# EasyEDA Pro project ProPrj_ROV_MINI_CTRL_2026-11-13.epro, board ROV_MINI_CTRL_V2.0.0_1
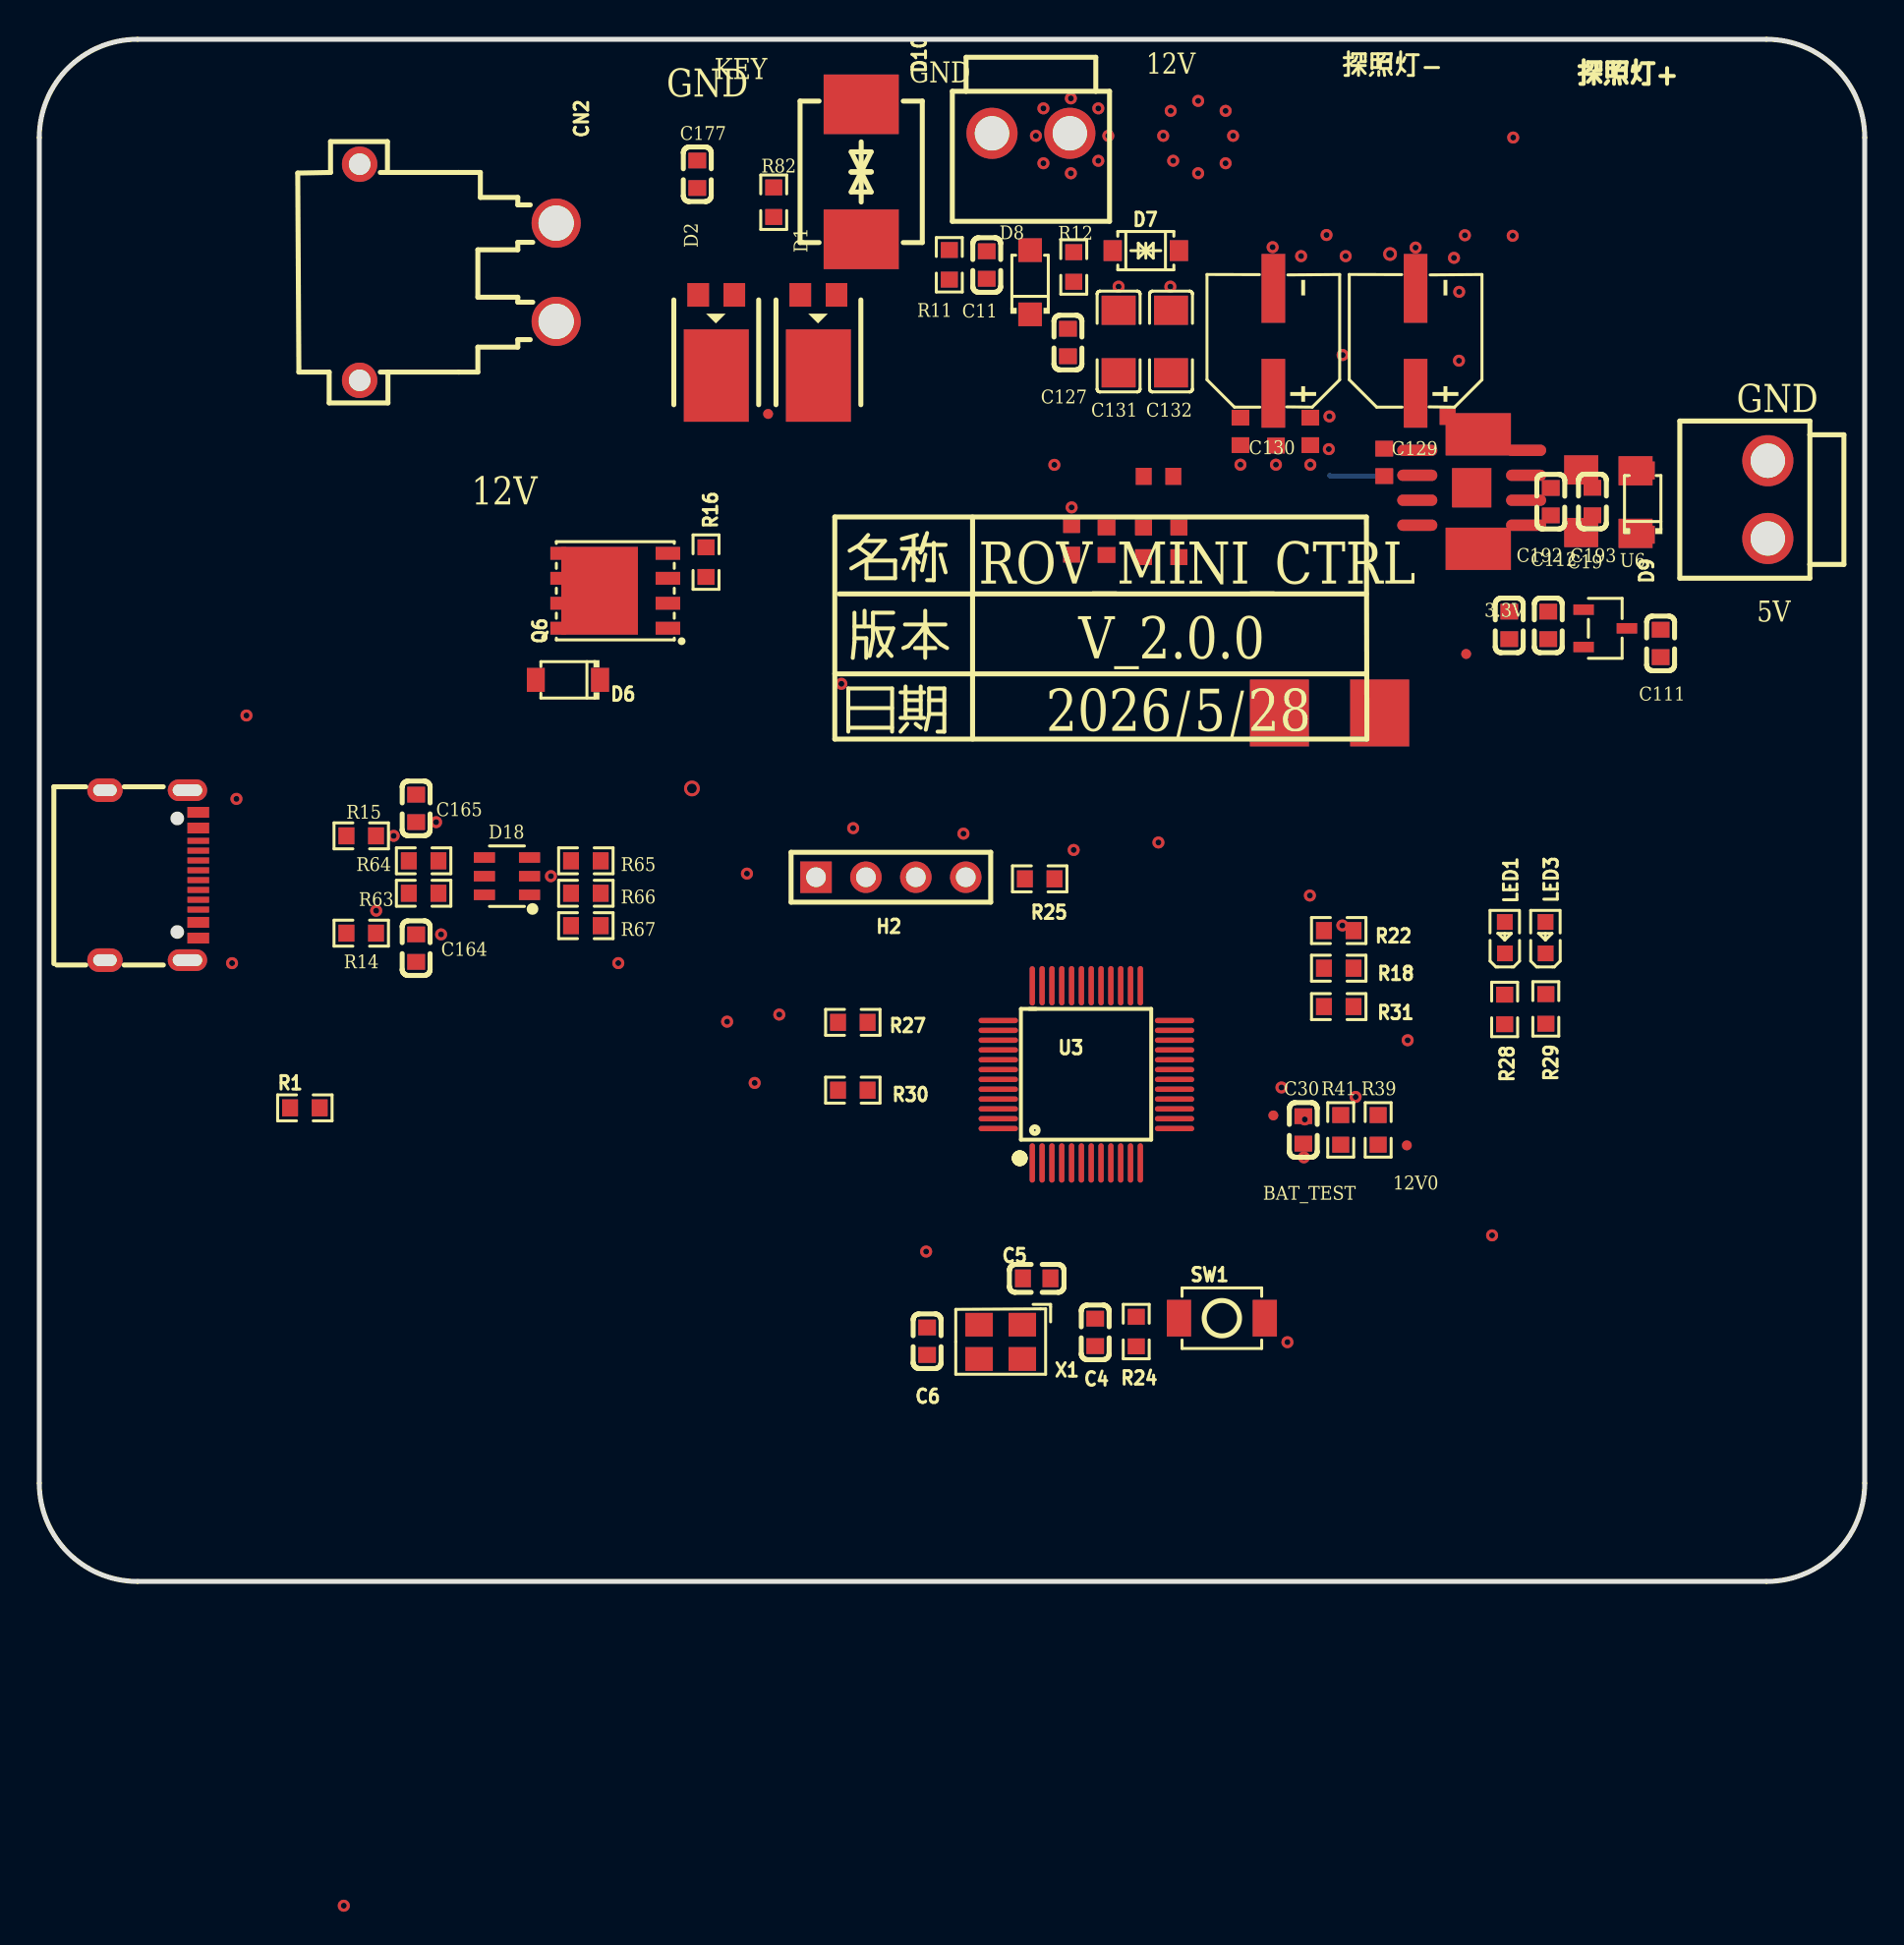
[diagram p16: board, top side]
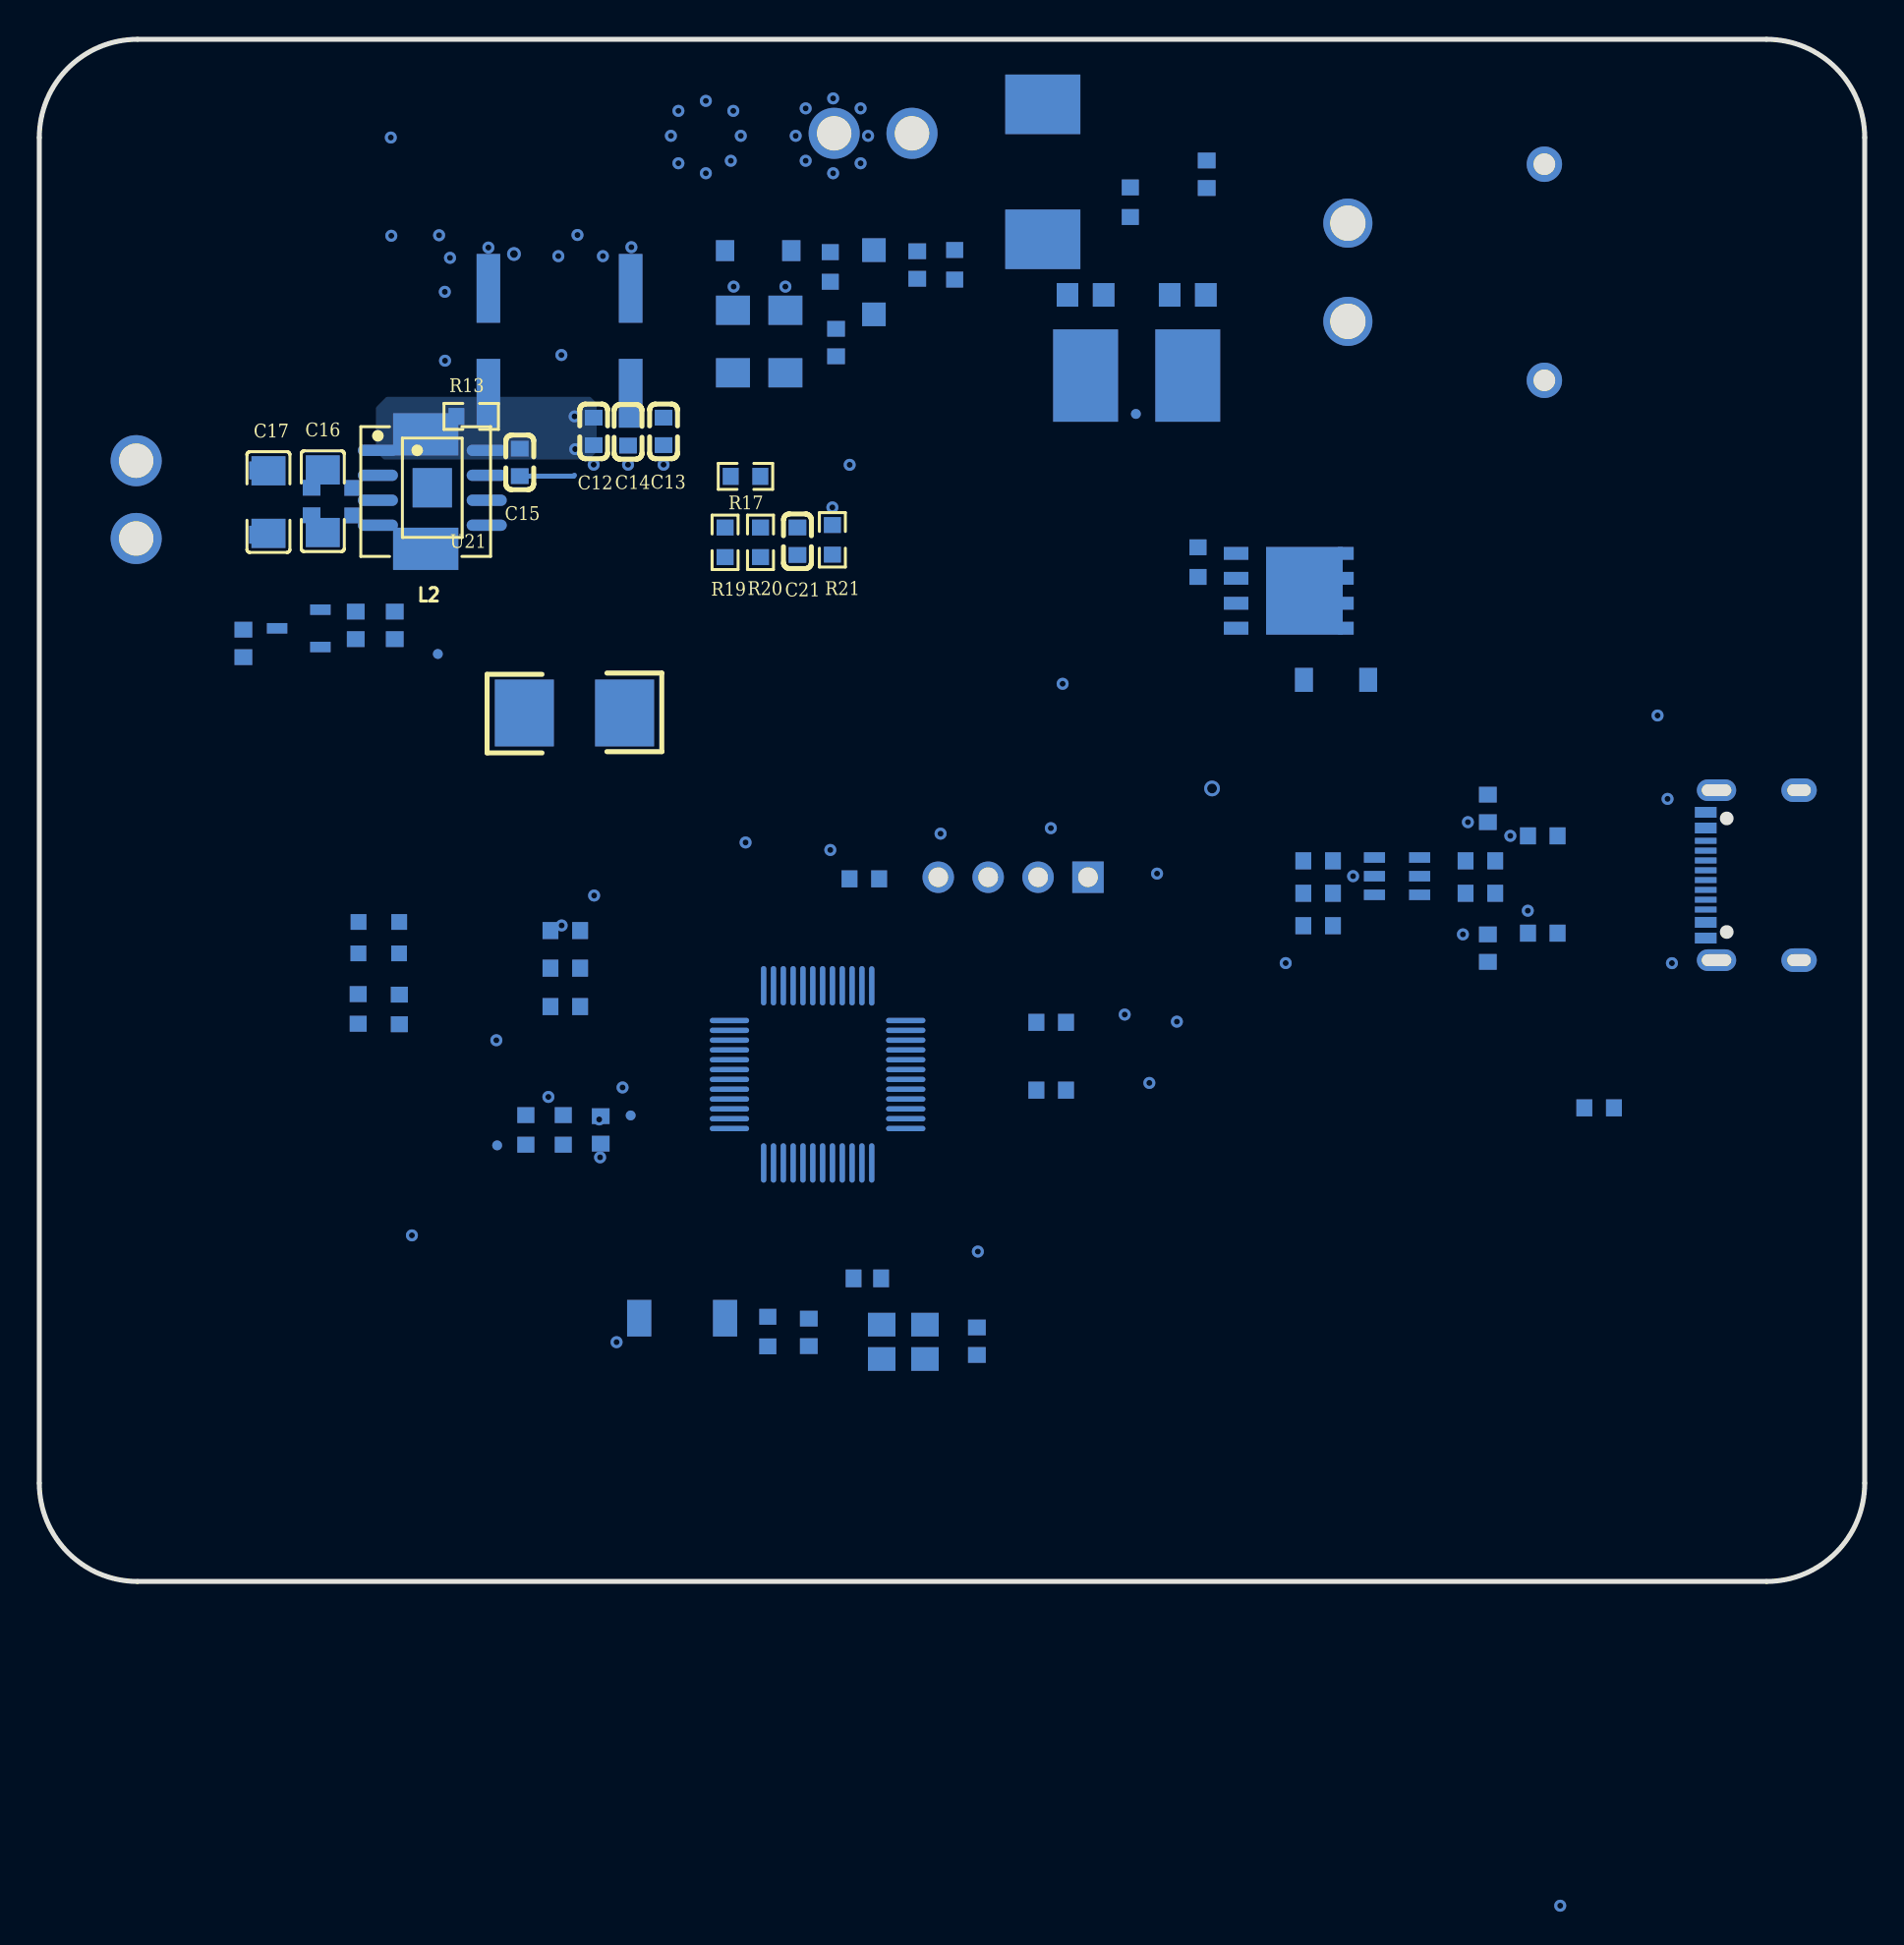
[diagram p17: board, bottom side, seen from below]

Outline 92.89 x 78.49 mm; copper layers: Top Layer, Bottom Layer. Coordinates in mm from the lower left corner of the outline.
Outline path: 0,73.49 0,5 arc(1.46,1.46) 5,0 87.89,0 arc(91.42,1.46) 92.89,5 92.89,73.49 arc(91.42,77.03) 87.89,78.49 5,78.49 arc(1.46,77.03) 0,73.49
Stack: Top Layer 0.035mm / Dielectric1 1.51mm FR4 er 4.5 / Bottom Layer 0.035mm

## Design rules (mm)
spacing copperThickness1oz (default): track to track 0.102, other pairs 0.152 to 0.3
spacing copperThickness2oz: track to track 0.203, other pairs 0.152 to 0.3
spacing Plane_innerPlane: track to track 0.102, other pairs 0.152 to 0.3
spacing Copper_copperRegion: track to track 0.102, other pairs 0.152 to 0.3
track width copperThickness1oz (default): min 0.127, default 0.254, max 2.54
track width copperThickness2oz: min 0.203, default 0.254, max 2.54
differential pair differentialPair (default): width min 0.127, default 0.254, max 2.54; gap min 0.152, default 0.152
net class GND uses Copper_copperRegion, Plane_innerPlane
net 3V3 uses Copper_copperRegion, Plane_innerPlane
net 5V0 uses Copper_copperRegion, Plane_innerPlane
net 12V0_IN uses Copper_copperRegion, Plane_innerPlane
net GND uses Copper_copperRegion, Plane_innerPlane
net NRST uses Copper_copperRegion, Plane_innerPlane
net SWCLK uses Copper_copperRegion, Plane_innerPlane
net SWDIO uses Copper_copperRegion, Plane_innerPlane
net $7N447 uses Copper_copperRegion, Plane_innerPlane
net $7N1099 uses Copper_copperRegion, Plane_innerPlane
net $5N5769 uses Copper_copperRegion, Plane_innerPlane
net $5N5773 uses Copper_copperRegion, Plane_innerPlane
net $5N5566 uses Copper_copperRegion, Plane_innerPlane
net $5N5491 uses Copper_copperRegion, Plane_innerPlane
net $6N1333 uses Copper_copperRegion, Plane_innerPlane
net $6N1784 uses Copper_copperRegion, Plane_innerPlane
net $6N582 uses Copper_copperRegion, Plane_innerPlane
net $6N719 uses Copper_copperRegion, Plane_innerPlane
net $5N2875 uses Copper_copperRegion, Plane_innerPlane
net $5N2878 uses Copper_copperRegion, Plane_innerPlane
net $7N2109 uses Copper_copperRegion, Plane_innerPlane
net $7N2149 uses Copper_copperRegion, Plane_innerPlane
net $6N3154 uses Copper_copperRegion, Plane_innerPlane
net $6N3161 uses Copper_copperRegion, Plane_innerPlane
net $6N3166 uses Copper_copperRegion, Plane_innerPlane
net I2C2_SDA uses Copper_copperRegion, Plane_innerPlane
net I2C2_SCL uses Copper_copperRegion, Plane_innerPlane
net $8N1202 uses Copper_copperRegion, Plane_innerPlane
net $8N1351 uses Copper_copperRegion, Plane_innerPlane
net $8N1499 uses Copper_copperRegion, Plane_innerPlane
net $8N1306 uses Copper_copperRegion, Plane_innerPlane
net 12V0 uses copperRegion_copperThickness1oz
pour e294 uses Copper_copperRegion, copperRegion_Copper_copperRegion
pour e296 uses Copper_copperRegion, copperRegion_Copper_copperRegion
pour e329 uses Copper_copperRegion, copperRegion_Copper_copperRegion
pour e335 uses Copper_copperRegion, copperRegion_Copper_copperRegion
pour e339 uses Copper_copperRegion, copperRegion_Copper_copperRegion
pour e341 uses Copper_copperRegion, copperRegion_Copper_copperRegion

## Placement (name value [footprint] x y rotation side)
3.3V  -  [Test-Point-0.5mm]  72.61 47.21 90 top
12V0  -  [Test-Point-0.5mm]  69.59 22.2 270 top
12V0_IN  -  [Test-Point-0.5mm]  37.09 59.42 0 top
BAT_TEST  -  [Test-Point-0.5mm]  62.79 23.72 270 top
C4  100nF  [C0603]  53.73 12.68 90 top
C5  100nF  [C0603]  50.75 15.43 180 top
C6  100nF  [C0603]  45.18 12.23 270 top
C11  100nF  [C0603]  48.21 67 270 top
C12  10uF  [C0603]  64.68 58.53 90 bottom
C13  10uF  [C0603]  61.12 58.53 90 bottom
C14  100nF  [C0603]  62.93 58.51 90 bottom
C15  100nF  [C0603]  68.44 56.96 270 bottom
C16  22uF  [C1206]  78.46 54.98 270 bottom
C17  22uF  [C1206]  81.23 54.94 270 bottom
C19  22uF  [C0603]  76.78 48.66 90 top
C21  2.7nF  [C0603]  54.31 52.94 90 bottom
C30  100nF  [C0603]  64.32 22.98 90 top
C111  1uF  [C0603]  82.5 47.74 90 top
C112  1uF  [C0603]  74.8 48.66 270 top
C127  100nF  [C0603]  52.34 63.06 270 top
C129  220uF  [CAP-SMD_BD6.3-L6.6-W6.6-LS7.2-FD]  70.03 63.14 90 top
C130  220uF  [CAP-SMD_BD6.3-L6.6-W6.6-LS7.2-FD]  62.79 63.14 90 top
C131  22uF  [C1206]  54.92 63.11 270 top
C132  22uF  [C1206]  57.59 63.11 270 top
C164  100nF  [C0603]  19.18 32.23 270 top
C165  10uF  [C0603]  19.18 39.35 90 top
C177  220nF  [C0603]  33.48 71.62 270 top
C192  10uF  [C0603]  76.91 54.96 270 top
C193  100nF  [C0603]  79.03 54.97 90 top
CN1  VH3.96-2P ZZ  [CONN-TH_2P-P3.96_C9900035759]  50.46 73.71 0 top
CN2  XT30PW-M30.G.Y  [CONN-TH_XT30PW-M]  21.3 66.63 270 top
CN22  VH3.96-2P ZZ  [CONN-TH_2P-P3.96_C9900035759]  87.96 55.06 270 top
D1  SB1045L  [TO-277_3P-L5.4-W4.0-LS6.5-TR]  39.65 63.43 90 top
D2  SB1045L  [TO-277_3P-L5.4-W4.0-LS6.5-TR]  34.45 63.43 90 top
D6  BZT52C12  [SOD-123_L2.7-W1.6-LS3.7-RD]  26.9 45.89 180 top
D7  SJD12C12L01  [SOD-123_L2.8-W1.8-LS3.7-BI]  56.31 67.73 0 top
D8  DSK24  [SOD-123FL_L2.7-W1.8-LS3.8-RD]  50.42 66.13 90 top
D9  BZT52B5V1  [SOD-123_L2.7-W1.6-LS3.7-RD]  81.59 54.91 90 top
D10  5.0SMDJ15CA  [SMC_L6.9-W5.9-LS7.9-BI]  41.82 71.75 270 top
D18  USBLC6-2SC6  [SOT-23-6_L2.9-W1.6-P0.95-LS2.8-BL]  23.8 35.9 90 top
H2  LAIL-PZ2.54-4P-L  [CONN-TH_LAIL-PZ2.54-4P-L]  43.33 35.84 0 top
L2  10uH  [IND-SMD_L7.1-W6.6]  73.22 55.47 270 bottom
LED1  XL-1608SURC-06  [LED0603-RD_RED]  74.58 32.77 90 top
LED3  XL-1608SURC-06  [LED0603-RD_RED]  76.65 32.77 90 top
Q6  MSK50P03NF  [DFN-8_L6.0-W5.0-P1.27-LS6.2-BL]  29.2 50.42 90 top
R1  3.3Ω  [R0603]  13.51 24.1 0 top
R11  47K  [R0603]  46.31 67.01 270 top
R12  3R3  [R0603]  52.64 66.9 270 top
R13  100K  [R0603]  70.91 59.3 180 bottom
R14  5.1kΩ  [R0603]  16.38 33 180 top
R15  5.1kΩ  [R0603]  16.38 37.95 180 top
R16  10K  [R0603]  33.93 51.88 90 top
R17  137K  [R0603]  56.95 56.25 180 bottom
R18  10K  [R0603]  66.12 31.21 0 top
R19  150K  [R0603]  57.99 52.89 270 bottom
R20  27K  [R0603]  56.19 52.89 90 bottom
R21  24K  [R0603]  52.53 53.02 270 bottom
R22  10K  [R0603]  66.12 33.13 180 top
R24  10K  [R0603]  55.82 12.72 90 top
R25  10K  [R0603]  50.91 35.76 180 top
R27  10K  [R0603]  41.4 28.46 180 top
R28  1kΩ  [R0603]  74.56 29.11 90 top
R29  1kΩ  [R0603]  76.66 29.14 90 top
R30  10K  [R0603]  41.4 25.01 180 top
R31  10K  [R0603]  66.12 29.26 180 top
R37  0Ω  [RES-SMD_L6.4-W3.2-A]  65.65 44.2 0 bottom
R39  100K  [R0603]  68.13 22.98 270 top
R41  27k  [R0603]  66.22 22.98 90 top
R63  33Ω  [R0603]  19.56 35.03 180 top
R64  33Ω  [R0603]  19.56 36.68 0 top
R65  33Ω  [R0603]  27.81 36.68 180 top
R66  33Ω  [R0603]  27.81 35.03 180 top
R67  10kΩ  [R0603]  27.81 33.38 0 top
R82  649kΩ  [R0603]  37.37 70.2 270 top
SW1  TS-1088-AR02016  [SW-SMD_L3.9-W3.0-P4.45]  60.18 13.4 0 top
U3  STM32F103C8T6  [LQFP-48_L7.0-W7.0-P0.50-LS9.0-BL]  53.28 25.8 0 top
U6  XC6206P332MR  [SOT-23-3_L3.0-W1.7-P0.95-LS2.9-BR]  79.68 48.51 180 top
U21  RT7272BGSP  [SOIC-8_L5.0-W4.0-P1.27-LS6.0-BL-EP2.0]  72.89 55.67 270 bottom
USB1  TYPE-C 16PIN 2MD(073)  [USB-C-SMD_TYPE-C-6PIN-2MD-073]  5.72 35.95 270 top
X1  8MHz  [CRYSTAL-SMD_4P-L3.2-W2.5-BL-1]  48.92 12.2 180 top

## Footprints (pads in the part's own frame, mm; a bottom-side part is the same pattern mirrored in y, then rotated)
C0603
  rect 0.8x0.9 hole 0.001: 1(-0.7,0) 2(0.7,0)
C1206
  rect 1.485x1.728 hole 0.001: 1(-1.593,0) 2(1.593,0)
CAP-SMD_BD6.3-L6.6-W6.6-LS7.2-FD
  rect 3.5x1.2 hole 0.001: 1(-2.67,0) 2(2.67,0)
CONN-TH_2P-P3.96_C9900035759
  round 2.6 hole 1.75: 1(-1.98,0) 2(1.98,0)
CONN-TH_LAIL-PZ2.54-4P-L
  rect 1.6x1.6 hole 1: 1(-3.81,0)
  round 1.6 hole 1: 2(-1.27,0) 3(1.27,0) 4(3.81,0)
CONN-TH_XT30PW-M
  round 2.5 hole 1.8: 1(-2.5,5) 2(2.5,5)
  round 1.8 hole 1.1: 3(5.5,-5) 4(-5.5,-5)
CRYSTAL-SMD_4P-L3.2-W2.5-BL-1
  rect 1.4x1.2 hole 0.001: 1(-1.1,-0.875) 2(1.1,-0.875) 3(1.1,0.875) 4(-1.1,0.875)
DFN-8_L6.0-W5.0-P1.27-LS6.2-BL
  rect 0.65x1.25 hole 0.001: 1(-1.905,-2.79) 2(-0.635,-2.79) 3(0.635,-2.79) 4(1.905,-2.79)
  rect 0.65x0.8 hole 0.001: 5(1.905,2.79) 6(0.635,2.79) 7(-0.635,2.79) 8(-1.905,2.79)
  rect 4.46x3.9 hole 0.001: 8(0,0.685)
IND-SMD_L7.1-W6.6
  rect 2.15x3.32 hole 0.001: 1(-2.913,0) 2(2.913,0)
LED0603-RD_RED
  rect 0.8x0.8 hole 0.001: 1(-0.799,-0.004) 2(0.799,0.004)
LQFP-48_L7.0-W7.0-P0.50-LS9.0-BL
  oval 0.27x2 hole 0.001: 1(-2.75,-4.5) 2(-2.25,-4.5) 3(-1.75,-4.5) 4(-1.25,-4.5) 5(-0.75,-4.5) 6(-0.25,-4.5) 7(0.25,-4.5) 8(0.75,-4.5) 9(1.25,-4.5) 10(1.75,-4.5) 11(2.25,-4.5) 12(2.75,-4.5) 25(2.75,4.52) 26(2.25,4.52) 27(1.75,4.52) 28(1.25,4.52) 29(0.75,4.52) 30(0.25,4.52) 31(-0.25,4.52) 32(-0.75,4.52) 33(-1.25,4.52) 34(-1.75,4.52) 35(-2.25,4.52) 36(-2.75,4.51)
  oval 2x0.27 hole 0.001: 13(4.49,-2.75) 14(4.49,-2.25) 15(4.49,-1.75) 16(4.49,-1.25) 17(4.49,-0.75) 18(4.49,-0.25) 19(4.49,0.25) 20(4.49,0.75) 21(4.49,1.25) 22(4.49,1.75) 23(4.49,2.25) 24(4.49,2.75) 37(-4.48,2.75) 38(-4.48,2.25) 39(-4.48,1.75) 40(-4.48,1.25) 41(-4.48,0.75) 42(-4.48,0.25) 43(-4.48,-0.25) 44(-4.48,-0.75) 45(-4.48,-1.25) 46(-4.48,-1.75) 47(-4.48,-2.25) 48(-4.48,-2.75)
R0603
  rect 0.806x0.864 hole 0.001: 1(-0.753,0) 2(0.753,0)
RES-SMD_L6.4-W3.2-A
  rect 3x3.4 hole 0.001: 1(-2.55,0) 2(2.55,0)
SMC_L6.9-W5.9-LS7.9-BI
  rect 3.03x3.82 hole 0.001: 1(-3.435,0) 2(3.435,0)
SOD-123_L2.7-W1.6-LS3.7-RD
  rect 0.91x1.22 hole 0.001: 1(-1.635,0) 2(1.635,0)
SOD-123_L2.8-W1.8-LS3.7-BI
  rect 0.93x1.06 hole 0.001: 1(1.685,0) 2(-1.685,0)
SOD-123FL_L2.7-W1.8-LS3.8-RD
  rect 1.2x1.2 hole 0.001: 1(-1.635,0) 2(1.635,0)
SOIC-8_L5.0-W4.0-P1.27-LS6.0-BL-EP2.0
  oval 0.574x2.038 hole 0.001: 1(-1.905,-2.769) 2(-0.635,-2.769) 3(0.635,-2.769) 4(1.905,-2.769) 5(1.905,2.769) 6(0.635,2.769) 7(-0.635,2.769) 8(-1.905,2.769)
  rect 2x2 hole 0.001: 9(0,0)
SOT-23-3_L3.0-W1.7-P0.95-LS2.9-BR
  rect 1.038x0.532 hole 0.001: 1(1.101,-0.95) 2(1.101,0.95) 3(-1.101,0)
SOT-23-6_L2.9-W1.6-P0.95-LS2.8-BL
  rect 0.532x1.072 hole 0.001: 1(-0.95,-1.149) 2(0,-1.149) 3(0.95,-1.149) 4(0.95,1.149) 5(0,1.149) 6(-0.95,1.149)
SW-SMD_L3.9-W3.0-P4.45
  rect 1.23x1.86 hole 0.001: 1(-2.185,0) 2(2.185,0)
Test-Point-0.5mm
  round 0.5 hole 0.001: 1(0,0)
TO-277_3P-L5.4-W4.0-LS6.5-TR
  rect 1.2x1.1 hole 0.001: 1(2.054,0.92) 3(2.054,-0.92)
  rect 4.7x3.3 hole 0.001: 2(-2.054,0)
USB-C-SMD_TYPE-C-6PIN-2MD-073
  rect 0.55x1.1 hole 0.001: 1(-3.2,2.375) 2(-2.4,2.375) 11(2.4,2.375) 12(3.2,2.375)
  rect 0.3x1.1 hole 0.001: 3(-1.75,2.375) 4(-1.25,2.375) 5(-0.75,2.375) 6(-0.25,2.375) 7(0.25,2.375) 8(0.75,2.375) 9(1.25,2.375) 10(1.75,2.375)
  oval 1.1x2 hole 0.6x1.5: 13(-4.325,1.825) 14(4.325,1.825)
  oval 1.2x1.8 hole 0.6x1.2: 13(-4.325,-2.375) 14(4.325,-2.375)

## Nets
As in the schematic, except:
GND: C4.1 C5.1 C6.2 C12.1 C13.1 C14.1 C16.1 C17.1 C19.2 C30.1 C111.1 C112.1 C127.1 C129.2 C130.2 C131.1 C132.1 C164.1 C165.1 C177.2 C192.1 C193.2 CN1.2 CN2.1 CN22.1 D6.2 D7.1 D9.2 D10.2 D18.2 H2.1 R14.1 R15.1 R17.2 R20.1 R21.1 R27.2 R28.1 R30.2 R31.1 R37.1 R37.2 R41.1 R82.2 SW1.2 U3.8 U3.23 U3.35 U3.47 U6.1 U21.4 U21.9 USB1.1 USB1.12 X1.2 X1.4

Pads without a net: CN2 3 4; U3 2 5 6 9 10 11 14 17 18 19 25 26 27 28 38 39 40 41 42 43 45 46; USB1 3 9 13 14

## Via types
v1: diameter 0.61, hole 0.305, Top Layer to Bottom Layer, 66 vias
v2: diameter 0.8, hole 0.5, Top Layer to Bottom Layer, 1 via
v3: diameter 0.7, hole 0.4, Top Layer to Bottom Layer, 1 via

## Routing (per net, layer and track width the routed paths; a pad name or vN(x,y) marks a point on that pad's centre or on a via; arc(x,y) is an arc through that point)
3V3:
  vias: v1(29.46,31.47) v1(52.63,37.23) v1(64.66,34.91) v2(33.21,40.36)
5V0:
  vias: v1(10.54,44.07)
12V0:
  vias: v1(65.65,59.3) v1(73.93,17.61)
GND:
  vias: v1(9.81,31.47) v1(10.03,39.83) v1(15.49,-16.5) v1(17.14,34.14) v1(18.03,37.95) v1(20.19,38.65) v1(20.45,32.93) v1(26.03,35.9) v1(35,28.49) v1(36.4,25.37) v1(37.66,28.85) v1(40.81,45.69) v1(45.13,16.79) v1(47.03,38.06) v1(50.71,73.58) v1(51.09,74.98) v1(51.09,72.18) v1(51.65,56.83) v1(52.49,75.48) v1(52.49,71.67) v1(52.53,54.67) v1(53.89,74.98) v1(53.89,72.31) v1(54.4,73.58) v1(54.92,65.9) v1(56.95,37.61) v1(57.19,73.58) v1(57.57,74.85) v1(57.55,65.9) v1(57.7,72.31) v1(58.97,75.36) v1(58.97,71.67) v1(60.37,74.85) v1(60.37,72.18) v1(60.75,73.58) v1(61.12,56.84) v1(62.76,67.91) v1(62.93,56.84) v1(63.21,25.14) v1(63.51,12.18) v1(64.21,67.46) v1(64.35,21.59) v1(64.68,56.84) v1(65.5,68.53) v1(65.62,57.63) v1(66.32,62.42) v1(66.31,33.39) v1(66.47,67.46) v1(69.63,27.55) v1(70.03,67.89) v1(71.99,67.37) v1(72.24,62.13) v1(72.25,65.64) v1(72.54,68.52) v1(75,73.49) v1(74.97,68.49) v3(68.73,67.56)
I2C2_SCL:
  vias: v1(64.4,23.51)
I2C2_SDA:
  vias: v1(66.98,24.66)
SWCLK:
  vias: v1(36.01,36.03) v1(41.41,38.34)
$9N50450: length 2.8
  Bottom Layer w0.254: C15.2 65.7,56.26 65.66,56.3

## Copper pours and planes (outline as drawn; the poured copper is in the pictures)
5V0 on In2.Cu: 18.72,51.82 14.1,51.82 12.57,53.35 2.16,53.35 1.52,53.98 1.52,59.57 2.29,60.33 17.14,60.33 17.4,60.08 17.4,54.87 17.91,54.36 18.67,54.36 19.18,53.85 19.18,52.28
12V0 on In2.Cu: 60.83,77.35 61.98,76.21 61.98,65.79 62.87,64.9 73.39,64.9 74.34,65.85 74.34,76.13 75.56,77.35 79.88,77.35 81.03,76.21 81.03,56.9 81.66,56.27 88.85,56.27 88.85,53.44 81.66,53.44 81.66,40.39 88.75,40.39 88.75,37.49 81.66,37.49 81.66,24.64 88.85,24.64 88.85,21.74 81.66,21.74 81.66,8.77 88.85,8.77 88.85,5.99 82.31,5.99 81.66,5.34 81.66,-7.11 88.76,-7.11 88.76,-10.03 75.31,-10.03 75.31,46.61 73.03,48.9 55.91,48.9 55.5,49.31 55.5,76.84 56.01,77.35
12V0 on In2.Cu: 44.32,56.39 44.45,56.52 49.28,56.52 50.55,57.79 70.61,57.79 71.88,56.52 71.88,52.33 68.45,48.9 48.9,48.9 45.09,45.09 28.32,45.09 27.91,45.5 27.91,48.11 28.32,48.52 43.56,48.52 44.32,49.28
12V0_IN on In1.Cu: 37.6,65.77 37.98,66.15 45.87,66.15 46.18,65.84 46.18,63.69 47.75,62.11 47.75,57.54 47.37,57.16 38.23,57.16 37.6,57.79
12V0_IN on In2.Cu: 37.6,65.77 37.98,66.15 45.87,66.15 46.18,65.84 46.18,63.69 47.75,62.11 47.75,57.54 47.37,57.16 38.23,57.16 37.6,57.79
GND on In1.Cu: 12.45,71.51 12.45,77.49 13.44,78.49 63.83,78.49 67.06,75.26 67.06,67.57 71.75,62.87 71.75,60.08 70.49,58.81 52.52,58.81 51.89,58.17 50.29,58.17 50.04,58.43 50.04,60.08 53.47,63.51 53.47,68.29 50.63,71.13 41.66,71.13 40.64,72.14 25.15,72.14 23.5,70.49 13.46,70.49
GND on In1.Cu: 1.57,52.12 2.16,52.71 8.51,52.71 12.45,56.65 12.45,77.48 13.46,78.49 23.11,78.49 24.13,77.48 24.13,63 30.3,56.82 43.54,56.82 44.01,56.35 44.01,49.35 43.43,48.77 36.07,48.77 35.94,48.9 35.94,50.17 37.08,51.31 37.08,52.84 37.21,52.96 37.97,52.96 38.35,53.35 38.35,54.23 38.05,54.54 35.3,54.54 35.1,54.34 35.1,53.4 34.93,53.22 33.4,53.22 33.19,53.43 33.19,54.45 33.02,54.62 29.08,54.62 27.31,52.84 27.31,48.96 25.34,48.96 25.27,49.03 25.27,51.3 25.01,51.56 22.74,51.56 22.22,52.08 22.22,54.23 21.59,54.87 18.98,54.87 18.65,55.21 18.65,60.22 15.9,60.22 15.37,59.7 15.37,55.12 9.65,49.41 2.16,49.41 1.57,50
GND on In1.Cu: 84.29,67.38 88.84,67.38 88.84,64.52 81.66,64.52 81.66,51.46 88.72,51.46 88.72,48.57 81.65,48.57 81.65,35.7 81.66,35.69 88.85,35.69 88.85,32.82 81.65,32.82 81.65,20.07 88.82,20.07 88.82,17.07 81.66,17.07 81.66,4.05 88.73,4.05 88.73,1.02 75.18,1.02 75.18,53.96 63.41,65.73 65,67.32 84.36,67.32
V1 on In1.Cu: 111.84,62.3 128.73,62.3 128.73,59.12 111.84,59.12
V1 on In2.Cu: 111.84,62.3 128.73,62.3 128.73,59.12 111.84,59.12
V2 on In1.Cu: 111.06,30.68 127.95,30.68 127.95,27.5 111.06,27.5
V2 on In2.Cu: 111.06,30.68 127.95,30.68 127.95,27.5 111.06,27.5
V3 on In1.Cu: 111.06,-1.45 127.95,-1.45 127.95,-4.63 111.06,-4.63
V3 on In2.Cu: 111.06,-1.45 127.95,-1.45 127.95,-4.63 111.06,-4.63
V4 on In1.Cu: 111.32,46.17 128.21,46.17 128.21,43 111.32,43
V4 on In2.Cu: 111.32,46.17 128.21,46.17 128.21,43 111.32,43
V5 on In1.Cu: 111.19,14.67 128.08,14.67 128.08,11.5 111.19,11.5
V5 on In2.Cu: 111.19,14.67 128.08,14.67 128.08,11.5 111.19,11.5
W1 on In1.Cu: 111.82,58.36 128.71,58.36 128.71,55.19 111.82,55.19
W1 on In2.Cu: 111.82,58.36 128.71,58.36 128.71,55.19 111.82,55.19
W2 on In1.Cu: 111.06,26.61 127.95,26.61 127.95,23.44 111.06,23.44
W2 on In2.Cu: 111.06,26.61 127.95,26.61 127.95,23.44 111.06,23.44
W3 on In1.Cu: 111.06,-5.52 127.95,-5.52 127.95,-8.69 111.06,-8.69
W3 on In2.Cu: 111.06,-5.52 127.95,-5.52 127.95,-8.69 111.06,-8.69
W4 on In1.Cu: 111.32,42.11 128.21,42.11 128.21,38.93 111.32,38.93
W4 on In2.Cu: 111.32,42.11 128.21,42.11 128.21,38.93 111.32,38.93
W5 on In1.Cu: 111.19,10.61 128.08,10.61 128.08,7.44 111.19,7.44
W5 on In2.Cu: 111.19,10.61 128.08,10.61 128.08,7.44 111.19,7.44
Y1 on In1.Cu: 111.89,66.17 128.78,66.17 128.78,63 111.89,63
Y1 on In2.Cu: 111.89,66.17 128.78,66.17 128.78,63 111.89,63
Y2 on In1.Cu: 111.06,34.49 127.95,34.49 127.95,31.31 111.06,31.31
Y2 on In2.Cu: 111.06,34.49 127.95,34.49 127.95,31.31 111.06,31.31
Y3 on In1.Cu: 111.06,2.36 127.95,2.36 127.95,-0.82 111.06,-0.82
Y3 on In2.Cu: 111.06,2.36 127.95,2.36 127.95,-0.82 111.06,-0.82
Y4 on In1.Cu: 111.32,49.98 128.21,49.98 128.21,46.81 111.32,46.81
Y4 on In2.Cu: 111.32,49.98 128.21,49.98 128.21,46.81 111.32,46.81
Y5 on In1.Cu: 111.19,18.48 128.08,18.48 128.08,15.31 111.19,15.31
Y5 on In2.Cu: 111.19,18.48 128.08,18.48 128.08,15.31 111.19,15.31
$9N50406 on In2.Cu: 26.91,69.39 27.63,70.11 31.24,70.11 31.5,69.86 36.58,69.86 36.58,57.66 36.32,57.41 32.89,57.41 26.91,63.39
$9N50407 on In2.Cu: 12.45,69.6 25.4,69.6 25.4,61.73 12.45,61.73
$9N50451 on Bottom Layer: 75.35,57.1 64.91,57.1 64.52,57.49 64.52,59.97 64.84,60.29 75.22,60.29 75.76,59.75 75.76,57.51
$9N50451 on In1.Cu: 13.59,48.39 24.48,48.39 25.02,47.85 25.02,46.11 24.26,45.34 13.72,45.34 13.08,45.98 13.08,47.88

Small or netless copper shapes (teardrops, artwork), in the pictures only: 2 on In1.Cu, 47 on In2.Cu

## Text on the board
Top Silkscreen Layer: KEY | GND | 12V | 探照灯- | 探照灯+ | 5V | 日期 | 名称 | 版本 | ROV_MINI_CTRL | 2026/5/28 | V_2.0.0
